# EasyEDA Pro project trumpx-ipadrescreen-ipad34-c6ab9950.epro, board PCB_B
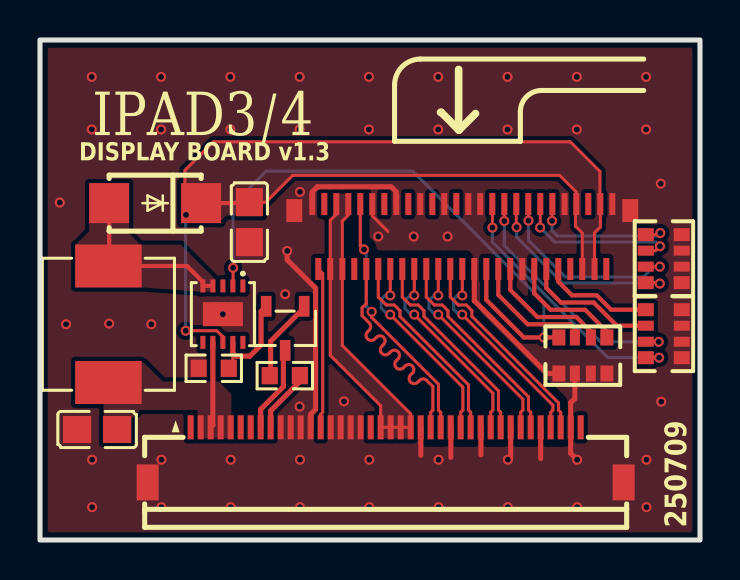
[diagram p10: board, top side]
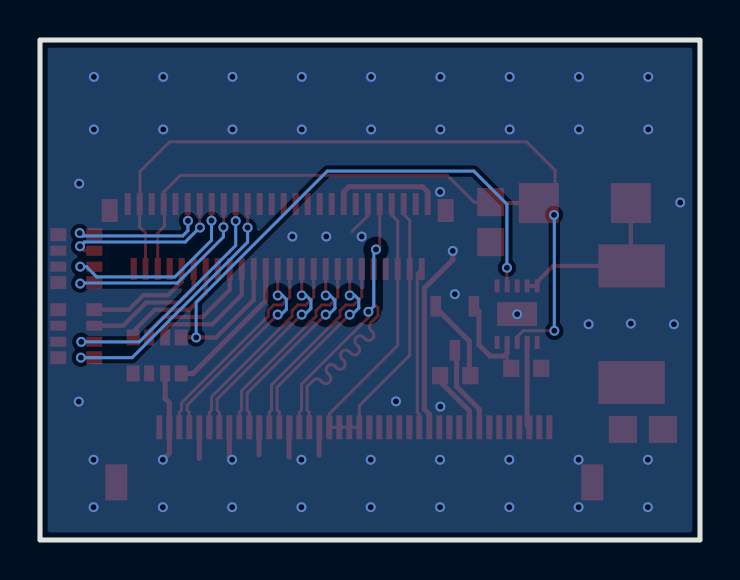
[diagram p11: board, bottom side, seen from below]

Outline 33 x 25 mm; copper layers: Top Layer, Bottom Layer. Coordinates in mm from the lower left corner of the outline.
Outline path: rectangle 0,25 33,0
Stack: Top Layer 0.035mm - / Dielectric1 1.51mm FR4 er 4.5 / Bottom Layer 0.035mm -

## Design rules (mm)
net DP_AUX_N: DP5
net DP_AUX_P: DP5
net DP_LANE0_P: DP4
net DP_LANE0_N: DP4
net DP_LANE1_P: DP3
net DP_LANE1_N: DP3
net DP_LANE2_P: DP2
net DP_LANE2_N: DP2
net DP_LANE3_P: DP1
net DP_LANE3_N: DP1
spacing safeClearance (default): track to track 0.152, other pairs 0.127 to 0.3
spacing Plane_innerPlane: track to track 0.152, other pairs 0.127 to 0.3
spacing Plane_highseepd: track to track 0.152, other pairs 0.127 to 0.3
spacing Copper_copperRegion: track to track 0.152, other pairs 0.127 to 0.3
spacing Copper_highseppd: track to track 0.152, other pairs 0.127 to 0.3
track width trackWidth (default): min 0.127, default 0.254, max 2.54
differential pair differentialPair (default): width min 0.127, default 0.127, max 0.254; gap min 0.127, default 0.127
net DP_AUX_N uses highseepd, highseppd
net DP_AUX_P uses highseepd, highseppd
net DP_LANE0_P uses highseepd, highseppd
net DP_LANE0_N uses highseepd, highseppd
net DP_LANE1_P uses highseepd, highseppd
net DP_LANE1_N uses highseepd, highseppd
net DP_LANE2_P uses highseepd, highseppd
net DP_LANE2_N uses highseepd, highseppd
net DP_LANE3_P uses highseepd, highseppd
net DP_LANE3_N uses highseepd, highseppd
pour e382 uses Copper_copperRegion
pour e384 uses Copper_copperRegion
pour e386 uses Copper_copperRegion
pour e388 uses Copper_copperRegion
pour e390 uses Copper_copperRegion
pour e392 uses Copper_copperRegion
pour e394 uses Copper_copperRegion

## Placement (name value [footprint] x y rotation side)
C1  10uF  [C0805]  2.86 5.53 0 top
C2  10uF  [C0805]  10.47 15.89 90 top
D3  SS34_C8678  [DO-214AC_L4.3-W2.7-LS5.3-RD]  5.76 16.84 180 top
FPC2  -  [FPC-IPAD3-TB]  21.11 15.2 180 top
FPC6  X05A15L40T  [FFC-SMD_40P-P0.50_XKB_X05A15L40T]  17.28 4.26 0 top
L1  10uH  [IND-SMD_L7.1-W6.6]  3.42 10.79 90 top
Q1  S8050 J3Y  [SOT-23-3_L3.0-W1.7-P0.95-LS2.9-BR]  12.26 10.59 90 top
R1  10kΩ  [R0603]  12.24 8.22 180 top
R2  10kΩ  [R0603]  8.69 8.59 0 top
RN1  12Ω  [RES-ARRAY-SMD_0603-8P-L3.2-W1.6-BL]  27.14 9.23 180 top
RN2  12Ω  [RES-ARRAY-SMD_0603-8P-L3.2-W1.6-BL]  31.19 10.31 270 top
RN3  12Ω  [RES-ARRAY-SMD_0603-8P-L3.2-W1.6-BL]  31.19 14.07 270 top
U1  SY7203DBC  [DFN-10_L3.0-W3.0-P0.50-BL-EP]  9.14 11.29 180 top

## Footprints (pads in the part's own frame, mm; a bottom-side part is the same pattern mirrored in y, then rotated)
C0805
  rect 1.41x1.35 smd: 1(-1,0) 2(1,0)
DFN-10_L3.0-W3.0-P0.50-BL-EP
  rect 0.25x0.65 smd: 1(-1,-1.411) 2(-0.5,-1.411) 3(0,-1.411) 4(0.5,-1.411) 5(1,-1.411) 6(1,1.411) 7(0.5,1.411) 8(0,1.411) 9(-0.5,1.411) 10(-1,1.411)
  rect 2x1.2 smd: 11(0,0)
DO-214AC_L4.3-W2.7-LS5.3-RD
  rect 2x2 smd: 1(-2.3,0) 2(2.3,0)
FFC-SMD_40P-P0.50_XKB_X05A15L40T
  rect 0.3x1.2 smd: 1(-9.75,1.377) 2(-9.25,1.377) 3(-8.75,1.377) 4(-8.25,1.377) 5(-7.75,1.377) 6(-7.25,1.377) 7(-6.75,1.377) 8(-6.25,1.377) 9(-5.75,1.377) 10(-5.25,1.377) 11(-4.75,1.377) 12(-4.25,1.377) 13(-3.75,1.377) 14(-3.25,1.377) 15(-2.75,1.377) 16(-2.25,1.377) 17(-1.75,1.377) 18(-1.25,1.377) 19(-0.75,1.377) 20(-0.25,1.377) 21(0.25,1.377) 22(0.75,1.377) 23(1.25,1.377) 24(1.75,1.377) 25(2.25,1.377) 26(2.75,1.377) 27(3.25,1.377) 28(3.75,1.377) 29(4.25,1.377) 30(4.75,1.377) 31(5.25,1.377) 32(5.75,1.377) 33(6.25,1.377) 34(6.75,1.377) 35(7.25,1.377) 36(7.75,1.377) 37(8.25,1.377) 38(8.75,1.377) 39(9.25,1.377) 40(9.75,1.377)
  rect 1.1x1.8 smd: 41(11.9,-1.377) 42(-11.9,-1.377)
FPC-IPAD3-TB
  rect 0.3x1.1 smd: 1(7.5,-1.595) 2(7.2,1.651) 3(6.9,-1.595) 4(6.6,1.651) 5(6.3,-1.595) 6(6,1.651) 7(5.7,-1.595) 8(5.401,1.651) 9(5.101,-1.595) 10(4.8,1.651) 11(4.5,-1.595) 12(4.2,1.651) 13(3.9,-1.595) 14(3.6,1.651) 15(3.3,-1.595) 16(3,1.651) 17(2.7,-1.595) 18(2.401,1.651) 19(2.1,-1.595) 20(1.8,1.651) 21(1.5,-1.595) 22(1.2,1.651) 23(0.9,-1.595) 24(0.6,1.651) 25(0.3,-1.595) 26(0.001,1.651) 27(-0.299,-1.595) 28(-0.6,1.651) 29(-0.899,-1.595) 30(-1.2,1.651) 31(-1.5,-1.595) 32(-1.8,1.651) 33(-2.1,-1.595) 34(-2.4,1.651) 35(-2.7,-1.595) 36(-2.999,1.651) 37(-3.3,-1.595) 38(-3.599,1.651) 39(-3.9,-1.595) 40(-4.2,1.651) 41(-4.503,-1.595) 42(-4.8,1.651) 43(-5.112,-1.595) 44(-5.4,1.651) 45(-5.7,-1.595) 46(-6,1.651) 47(-6.3,-1.595) 48(-6.611,1.651) 49(-6.9,-1.595) 50(-7.2,1.651) 51(-7.5,-1.595)
  rect 0.8x1.15 smd: 52(-8.4,-1.27) 53(8.4,-1.27)
IND-SMD_L7.1-W6.6
  rect 2.15x3.32 smd: 1(-2.913,0) 2(2.913,0)
R0603
  rect 0.806x0.864 smd: 1(-0.753,0) 2(0.753,0)
RES-ARRAY-SMD_0603-8P-L3.2-W1.6-BL
  rect 0.65x0.8 smd: 1(-1.2,-0.9) 4(1.2,-0.9) 5(1.2,0.9) 8(-1.2,0.9)
  rect 0.5x0.8 smd: 2(-0.4,-0.9) 3(0.4,-0.9) 6(0.4,0.9) 7(-0.4,0.9)
SOT-23-3_L3.0-W1.7-P0.95-LS2.9-BR
  rect 1.038x0.532 smd: 1(1.101,-0.95) 2(1.101,0.95) 3(-1.101,0)

## Nets
As in the schematic.

Pads without a net: FPC2 3 8 13 17 21 25 44 47 50; FPC6 1 6 40; U1 1 3 6 10

## Via types
v1: diameter 0.5, hole 0.299, Top Layer to Bottom Layer, 77 vias

## Routing (per net, layer and track width the routed paths; a pad name or vN(x,y) marks a point on that pad's centre or on a via; arc(x,y) is an arc through that point)
GND: length 36.1
  Top Layer w0.152: 17.4,15.43 16.61,16.21 FPC2.11
  Top Layer w0.254: 20.54,4.13 20.54,5.62 FPC6.27 ; v1(12.36,14.45) 12.36,14.01 13.78,12.59 13.78,6.53 13.53,6.29 FPC6.13 ; 22.05,4.26 22.05,5.62 FPC6.30 ; 19.04,4.24 19.04,5.62 FPC6.24 ; v1(26.86,4.01) 26.53,4.34 FPC6.39 26.53,6.86 26.74,7.07 RN1.6 ; FPC2.15 17.81,17.41 17.56,17.66 13.87,17.66 13.61,17.41 FPC2.1 ; FPC2.28 21.71,11.96 25.35,8.33 RN1.5 ; 23.52,4.11 23.53,4.12 FPC6.33 ; 25.03,5.63 25.03,4.07
  vias: v1(0.99,16.87) v1(1.3,10.79) v1(2.59,23.16) v1(2.59,20.53) v1(2.61,4.01) v1(2.61,1.64) v1(3.46,10.82) v1(5.57,10.79) v1(6.05,23.16) v1(6.05,20.53) v1(6.07,4.01) v1(6.07,1.64) v1(9.14,11.29) v1(9.52,23.16) v1(9.52,20.53) v1(9.54,4.01) v1(9.54,1.64) v1(12.26,12.29) v1(12.98,23.16) v1(12.98,20.53) v1(13,17.4) v1(12.98,6.67) v1(13,4.01) v1(13,1.64) v1(15.2,6.93) v1(16.45,23.16) v1(16.45,20.53) v1(16.46,4.01) v1(16.46,1.64) v1(16.91,15.17) v1(18.69,15.17) v1(19.91,23.16) v1(19.91,20.53) v1(19.93,4.01) v1(19.93,1.64) v1(20.38,15.17) v1(23.38,23.16) v1(23.38,20.53) v1(23.39,4.01) v1(23.39,1.64) v1(26.84,23.16) v1(26.84,20.53) v1(26.86,1.64) v1(30.3,23.16) v1(30.3,20.53) v1(30.32,4.01) v1(30.32,1.64) v1(31.04,17.82) v1(31.06,6.92)
VCC3.3: length 26.5
  Top Layer w0.152: FPC2.7 15.41,16.25 15.11,15.95 FPC2.6 15.11,9.73 18.53,6.31 FPC6.23 FPC6.22 FPC6.21 FPC6.20 17.03,6.71 14.51,9.23 FPC2.4 14.51,15.98 14.81,16.28 FPC2.5
VCC12B: length 4.3
  Top Layer w0.254: FPC6.3 8.64,5.74 U1.7
BL_EN: length 3.2
  Top Layer w0.254: R1.1 12.99,7.92 11.53,6.46 FPC6.9
DP_AUX_N: length 12.8
  Top Layer w0.152: FPC2.10 16.31,11.82 16.1,11.61 16.1,11.21 16.46,10.85 arc(16.54,10.67) 16.46,10.5 16.37,10.41 arc(16.37,10.05) 16.73,10.05 16.82,10.14 arc(17.18,10.14) 17.18,9.78 17.09,9.69 arc(17.09,9.33) 17.45,9.33 17.54,9.42 arc(17.9,9.42) 17.9,9.06 17.81,8.97 arc(17.81,8.61) 18.17,8.61 18.26,8.7 arc(18.62,8.7) 18.62,8.34 18.53,8.25 arc(18.53,7.89) 18.89,7.89 18.98,7.98 arc(19.16,8.05) 19.34,7.98 19.64,7.67 19.64,6.5 19.53,6.39 FPC6.25
DP_AUX_P: length 12.8
  Top Layer w0.152: v1(16.2,14.53) 16.01,14.71 FPC2.9 ; v1(16.58,11.41) 16.58,11.13 19.92,7.79 19.92,6.5 20.03,6.39 FPC6.26
  Bottom Layer w0.152: v1(16.58,11.41) 16.31,11.68 16.31,14.42 v1(16.2,14.53)
DP_LANE0_N: length 10.1
  Top Layer w0.152: FPC6.29 21.53,6.39 21.42,6.5 21.42,7.76 18,11.18 18,11.47 17.71,11.75 17.31,11.75 16.91,12.15 FPC2.12
DP_LANE0_P: length 10.1
  Top Layer w0.152: v1(17.51,12.23) 17.51,12.23 FPC2.14 ; FPC6.28 21.03,6.39 21.14,6.5 21.14,7.64 v1(17.51,11.27)
  Bottom Layer w0.152: v1(17.51,11.27) 17.39,11.27 17.06,11.6 17.06,12.03 17.26,12.23 v1(17.51,12.23)
DP_LANE1_N: length 10.2
  Top Layer w0.152: FPC2.16 18.11,12.15 18.51,11.75 18.91,11.75 19.2,11.47 19.2,11.18 22.92,7.46 22.92,6.5 23.03,6.39 FPC6.32
DP_LANE1_P: length 10.2
  Top Layer w0.152: FPC2.18 18.71,12.23 v1(18.71,12.23) ; v1(18.71,11.27) 22.64,7.34 22.64,6.5 22.53,6.39 FPC6.31
  Bottom Layer w0.152: v1(18.71,12.23) 18.5,12.23 18.25,11.98 18.25,11.58 18.56,11.27 v1(18.71,11.27)
DP_LANE2_N: length 10.3
  Top Layer w0.152: FPC6.35 24.53,6.39 24.42,6.5 24.42,7.16 20.4,11.18 20.4,11.47 20.11,11.75 19.71,11.75 19.31,12.15 FPC2.20
DP_LANE2_P: length 10.3
  Top Layer w0.152: v1(19.91,12.23) 19.91,12.23 FPC2.22 ; v1(19.91,11.27) 24.14,7.04 24.14,6.5 24.03,6.39 FPC6.34
  Bottom Layer w0.152: v1(19.91,12.23) 19.7,12.23 19.46,11.99 19.46,11.57 19.76,11.27 v1(19.91,11.27)
DP_LANE3_N: length 10.4
  Top Layer w0.152: FPC2.24 20.51,12.15 20.91,11.75 21.31,11.75 21.59,11.47 21.59,11.19 25.92,6.86 25.92,6.5 26.03,6.39 26.03,5.63
DP_LANE3_P: length 10.4
  Top Layer w0.152: v1(21.11,12.23) 21.11,12.23 FPC2.26 ; FPC6.37 25.53,6.39 25.64,6.5 25.64,6.74 v1(21.11,11.27)
  Bottom Layer w0.152: v1(21.11,12.23) 20.88,12.23 20.68,12.03 20.68,11.53 20.94,11.27 v1(21.11,11.27)
HPD: length 8
  Top Layer w0.152: FPC2.2 14.14,13.33 14.14,6.39 14.03,6.28 FPC6.14
LEDA: length 61
  Top Layer w0.152: FPC2.46 27.11,15.35 26.77,15.69 26.77,16.76 FPC2.45 26.81,17.4 25.98,18.23 12.64,18.23 11.3,16.89 C2.2 ; v1(7.28,10.46) 8.84,10.46 9.14,10.16 U1.8 ; v1(7.3,16.25) 7.3,16.77 7.25,16.82 7.25,18.48 8.67,19.91 26.52,19.91 28,18.43 28,16.81 FPC2.49 28.02,16.79 28.02,15.65 27.73,15.35 FPC2.48
  Top Layer w0.211: D3.1 10.42,16.84 C2.2
  Bottom Layer w0.152: v1(7.28,10.46) 7.28,16.24 v1(7.3,16.25)
LEDA1: length 5.6
  Top Layer w0.211: RN2.1 28.56,11.51 27.83,12.24 26.6,12.24 25.91,12.92 FPC2.42
LEDA2: length 6.7
  Top Layer w0.211: FPC2.40 25.31,12.6 26.04,11.87 27.68,11.87 28.84,10.71 RN2.2
LEDA3: length 5.9
  Top Layer w0.211: RN1.1 28.34,10.42 27.26,11.51 25.54,11.51 24.71,12.33 FPC2.38
LEDA4: length 6.2
  Top Layer w0.211: RN1.2 27.54,10.42 26.82,11.15 24.87,11.15 23.51,12.5 FPC2.34
LEDA5: length 6.3
  Top Layer w0.211: FPC2.32 22.91,12.26 24.39,10.78 26.53,10.78 26.74,10.57 RN1.3
LEDA6: length 30.7
  Top Layer w0.152: v1(9.65,13.61) 9.65,12.71 U1.2
  Top Layer w0.211: FPC2.30 22.31,12.01 24.2,10.13 v1(25.19,10.13) RN1.4
  Bottom Layer w0.152: v1(25.19,10.13) 25.19,11.89 18.64,18.44 11.31,18.44 9.65,16.79 v1(9.65,13.61)
LEDB1: length 7.7
  Top Layer w0.152: v1(25.6,15.96) 25.6,16.78 FPC2.41 ; 30.29,15.27 30.93,15.27 v1(31.01,15.35)
  Bottom Layer w0.152: v1(25.6,15.96) 25.6,15.47 25.86,15.2 30.87,15.2 v1(31.01,15.35)
LEDB2: length 8.4
  Top Layer w0.152: FPC2.39 25.01,15.63 v1(25,15.62) ; v1(31,14.69) 30.78,14.47 30.29,14.47
  Bottom Layer w0.152: v1(31,14.69) 30.79,14.9 25.74,14.9 25.01,15.62 v1(25,15.62)
LEDB3: length 10.1
  Top Layer w0.152: v1(24.42,15.97) 24.42,16.79 FPC2.37 ; 30.29,13.67 v1(30.99,13.67)
  Bottom Layer w0.152: v1(24.42,15.97) 24.42,14.98 26.26,13.15 30.17,13.15 30.68,13.67 v1(30.99,13.67)
LEDB4: length 10.5
  Top Layer w0.152: v1(23.83,15.64) 23.81,15.66 FPC2.35 ; 30.29,12.87 30.94,12.87 v1(30.99,12.82)
  Bottom Layer w0.152: v1(30.99,12.82) 30.96,12.85 26.13,12.85 23.83,15.15 v1(23.83,15.64)
LEDB5: length 12.4
  Top Layer w0.152: RN2.3 30.93,9.91 v1(30.94,9.91) ; v1(23.21,15.95) FPC2.33
  Bottom Layer w0.152: v1(23.21,15.95) 23.21,14.73 28.03,9.91 v1(30.94,9.91)
LEDB6: length 13.3
  Top Layer w0.152: FPC2.31 22.62,16.79 v1(22.62,15.62) ; v1(30.95,9.12) 30.95,9.11 RN2.4
  Bottom Layer w0.152: v1(30.95,9.12) 28.39,9.12 22.62,14.89 v1(22.62,15.62)
PWM: length 4.4
  Top Layer w0.254: FPC6.8 11.03,6.53 12.17,7.67 12.17,9.4 Q1.3
PWMO: length 5.1
  Top Layer w0.152: 9.64,9.35 9.64,8.7 9.53,8.59
  Top Layer w0.254: U1.9 9.64,9.35 9.8,9.19 10.49,9.19 11.05,9.75 11.05,11.43 Q1.2
$1N26772: length 8.9
  Top Layer w0.211: U1.4 U1.5 8.14,12.9 7.35,13.7 L1.2 3.46,13.74 3.46,16.84
$1N32535: length 4.2
  Top Layer w0.254: R1.2 11.53,8.26 11.53,9.94 13.21,11.61 Q1.1

## Copper pours and planes (outline as drawn; the poured copper is in the pictures)
GND on Top Layer: 0.02,25.01 33.02,25.01 33.02,0.01 0.02,0.01
GND on Bottom Layer: 0,25 33,25 33,0 0,0
VCC3.3 on Top Layer: 14.82,17.31 15.57,17.31 15.42,16.25 15.11,15.95 15.11,9.73 18.53,6.31 18.53,5.08 17.09,5.08 17.03,5.14 17.03,6.71 14.51,9.23 14.51,15.98 14.81,16.28 14.81,16.8 14.82,16.8
VCC12B on Top Layer: 8.05,5.09 9.56,5.09 9.57,5.08 9.57,7.29 8.94,7.93 6.15,7.93 5.2,8.87 4.94,8.87 3.17,7.11 3.17,4.87 4.54,4.87 4.54,6.02 5.02,6.5 7.86,6.5 7.86,5.28
LEDA on Top Layer: 7.25,18.48 8.67,19.91 26.52,19.91 28,18.43 28,15.67 28.02,15.65 27.73,15.35 27.73,13.16 27.73,13.15 27.12,13.15 27.11,13.16 27.11,15.35 26.77,15.69 26.77,17.36 26.81,17.4 25.98,18.23 12.64,18.23 10.63,16.22 9.32,16.22 8.99,15.89 8.17,15.89 7.25,16.82
$1N26772 on Top Layer: 5.05,14.74 4.45,15.34 4.45,15.99 2.52,15.99 2.46,16.04 2.46,15.44 1.77,14.75 1.77,14.37 1.8,14.34 4.65,14.34
$1N26772 on Top Layer: 4.96,14.77 7.04,14.77 8.77,13.04 8.77,12.41 8.04,12.41 4.96,12.64

## Text on the board
Top Silkscreen Layer: DISPLAY BOARD v1.3 | 250709 | IPAD3/4
